# Altium schematic sheet Accel.SchDoc
size A; SheetNumber: 3; SheetTotal: 3
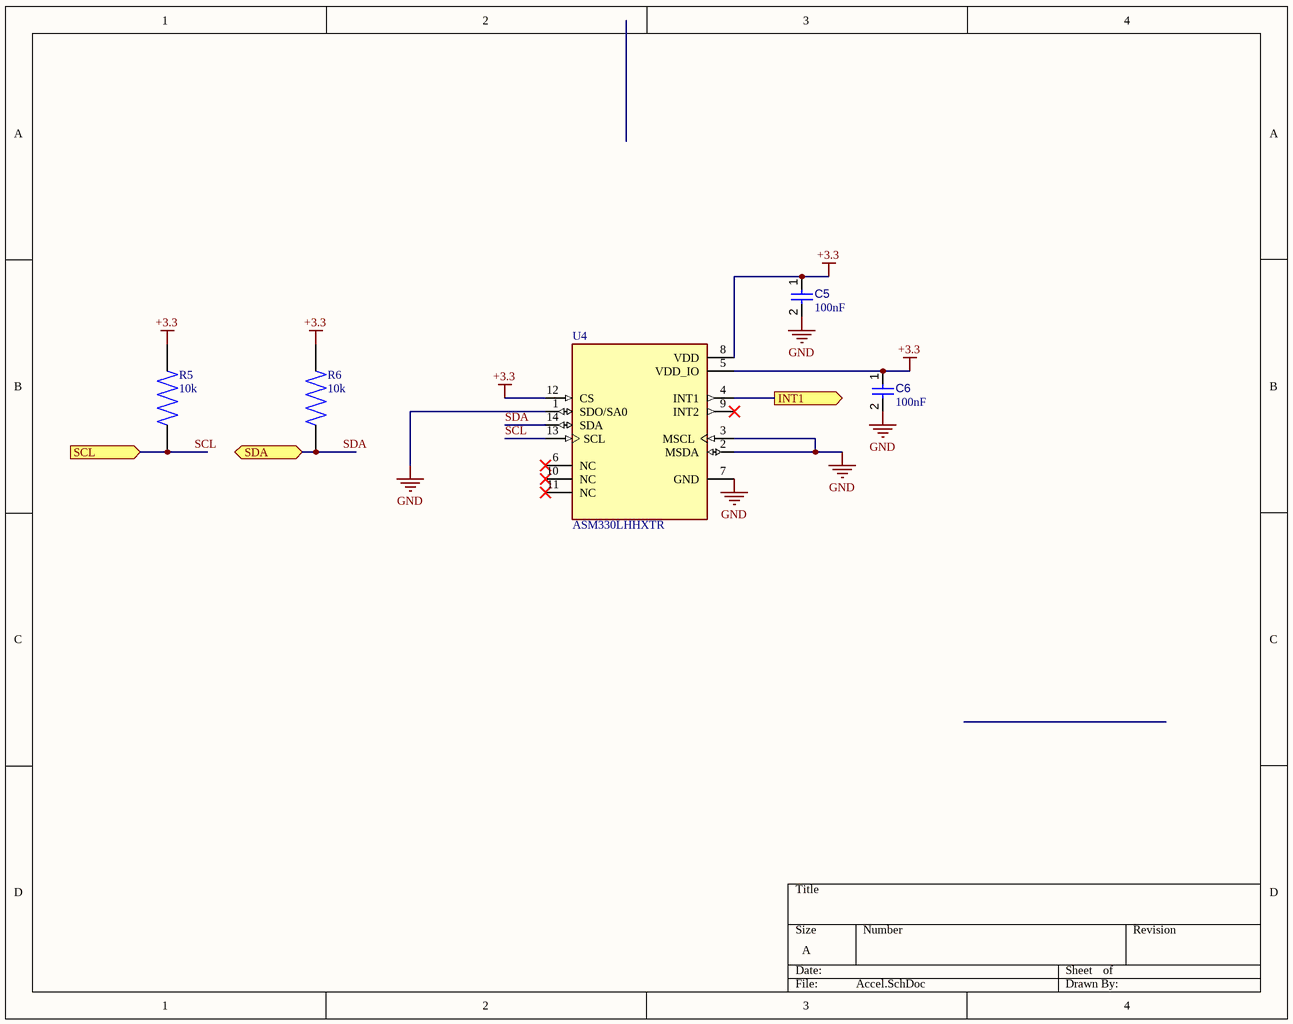
[diagram p0: Accel.SchDoc]

## Parts
C5  value 100nF  [KEMT-1206-2_L]  (hidden comment: C1206C104K5RACTU)
C6  value 100nF  [KEMT-1206-2_L]  (hidden comment: C1206C104K5RACTU)
R5  value 10k  [RESC3116X65N]  (hidden comment: RCS120610K0FKEA)
R6  value 10k  [RESC3116X65N]  (hidden comment: RCS120610K0FKEA)
U4  ASM330LHHXTR  [XDCR_ASM330LHHXTR]

## Ports
INT1 (out), SCL (in), SDA (bidir)

## Nets
+3.3: C5.1 C6.1 R5.2 R6.2 U4.5(VDD_IO) U4.8(VDD) U4.12(CS)
GND: C5.2 C6.2 U4.1(SDO/SA0) U4.2(MSDA) U4.3(MSCL) U4.7(GND)
INT1: U4.4(INT1) ; port INT1
SCL: R5.1 U4.13(SCL) ; port SCL
SDA: R6.1 U4.14(SDA) ; port SDA

Not connected (* = marked no-connect by the designer): U4 6(NC)* 9(INT2)* 10(NC)* 11(NC)*

## Library data of the parts
C5 C6 = CMP-001-00131-1: Multilayer Ceramic Capacitors MLCC – SMD/SMT; KEMET; C1206C104K5RACTU; 100 nF; 1206; 50 V; 50 V; Tolerance: 10%; Voltage Rating: 50V; Case/Package: 1206; Max Operating Temperature: 125°C; Min Operating Temperature: -55°C; Pins: 2; Mounting Technology: Surface Mount
R5 R6 = CMP-009-00195-1: 10 kOhms Â±1% 0.5W, 1/2W Chip Resistor 1206 (3216 Metric) Automotive AEC-Q200, Pulse Withstanding Thick Film; MF: Vishay Dale; Design Item ID: RCS120610K0FKEA; Case/Package: 3116 Vishay; Check_prices: https://www.snapeda.com/parts/RCS120610K0FKEA/Vishay+Dale/view-part/?ref=eda; Source: RCS120610K0FKEA.SchLib; Pins: 2; MP: RCS120610K0FKEA; Component Type: Standard; SnapEDA_Link: https://www.snapeda.com/parts/RCS120610K0FKEA/Vishay+Dale/view-part/?ref=snap
U4 = CMP-522-000000-1: Accelerometer, Gyroscope, Temperature, 6 Axis Sensor IÂ²C, I3Câ„ , SPI Output; MF: STMicroelectronics; Source: ASM330LHHXTR.SchLib; Component Type: Standard; SnapEDA_Link: https://www.snapeda.com/parts/ASM330LHHXTR/STMicroelectronics/view-part/?ref=snap; Package: VFLGA-14 STMicroelectronics; Value: *; Pin Count: 14; Design Item ID: ASM330LHHXTR; MP: ASM330LHHXTR; Check_prices: https://www.snapeda.com/parts/ASM330LHHXTR/STMicroelectronics/view-part/?ref=eda